# Altium schematic sheet 05.Motor_Drive.schdoc: 06.Motor_Drive
size A4; Revision: V1; SheetNumber: 7; SheetTotal: 7; Project: STC16F40K128
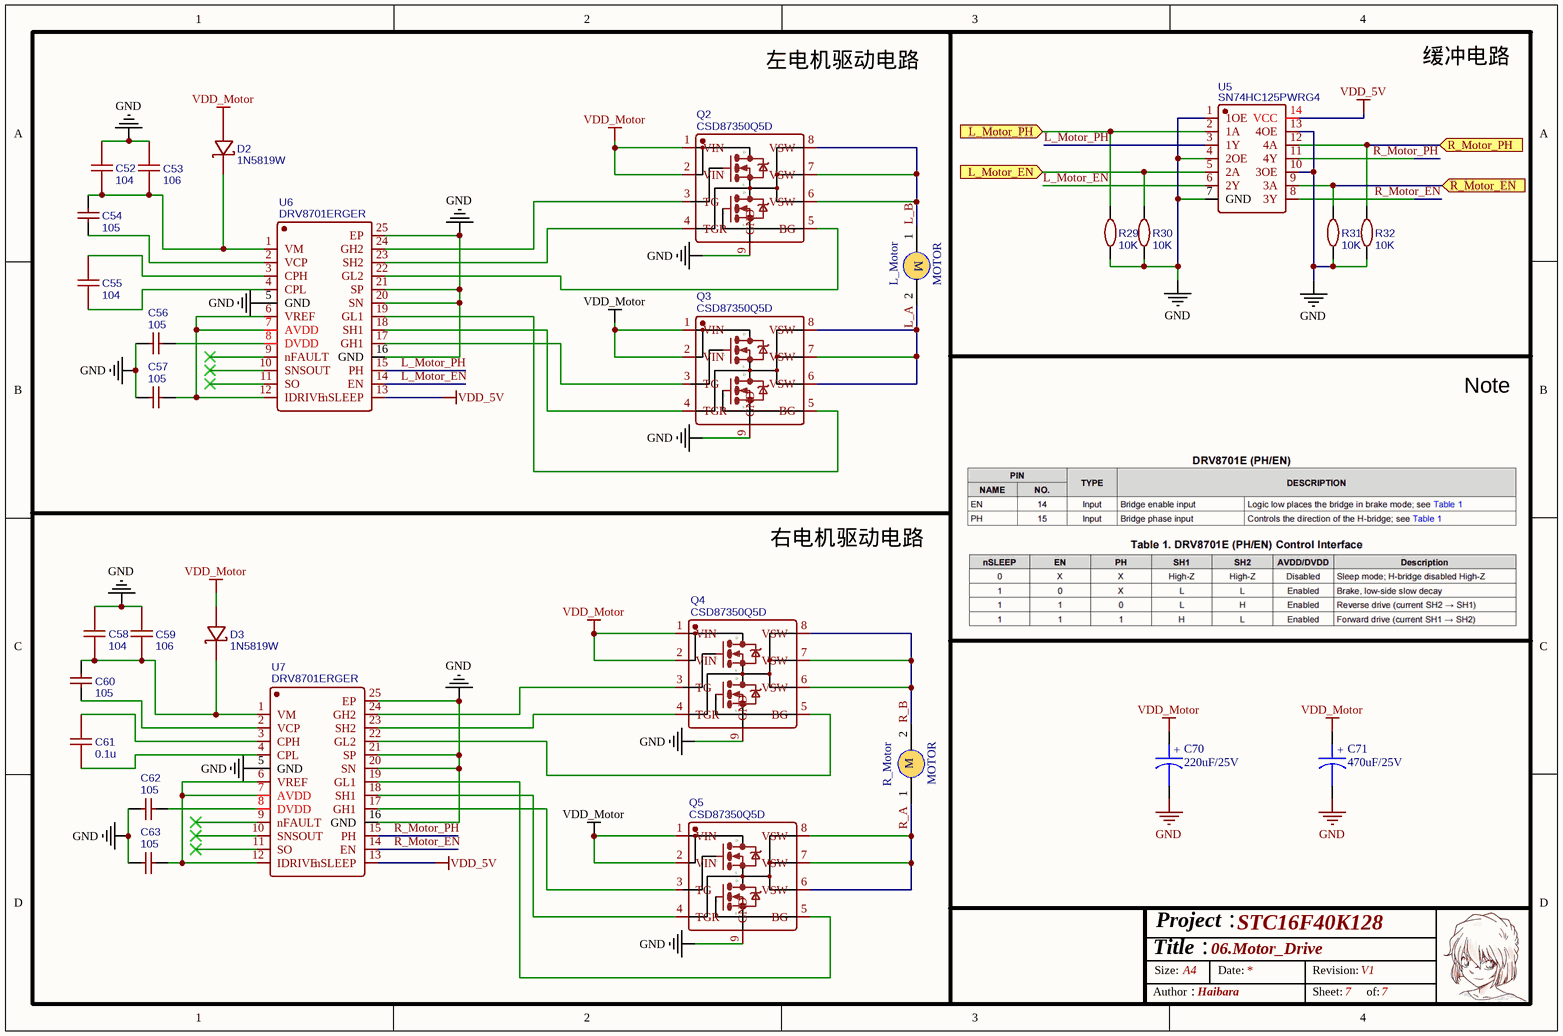
[diagram p0: 05.Motor_Drive.schdoc]

## Parts
C52  104  [C0603]
C53  106  [C0805]
C54  105  [C0603]
C55  104  [C0603]
C56  105  [C0603]
C57  105  [C0603]
C58  104  [C0603]
C59  106  [C0805]
C60  105  [C0603]
C61  0.1u  [C0603]
C62  105  [C0603]
C63  105  [C0603]
C70  220uF/25V  [CAP 2.5*6.3*11.2]
C71  470uF/25V  [CAP 3.5*8*11.5 - BK]
D2  1N5819W  [SOD-123F_L2.8-W1.8-LS3.7-RD]
D3  1N5819W  [SOD-123F_L2.8-W1.8-LS3.7-RD]
L_Motor  MOTOR  [XT30 母头 电源插头]
Q2  CSD87350Q5D  [LSON-8_L6.0-W5.0-P1.27-LS6.0-TL-EP]
Q3  CSD87350Q5D  [LSON-8_L6.0-W5.0-P1.27-LS6.0-TL-EP]
Q4  CSD87350Q5D  [LSON-8_L6.0-W5.0-P1.27-LS6.0-TL-EP]
Q5  CSD87350Q5D  [LSON-8_L6.0-W5.0-P1.27-LS6.0-TL-EP]
R29  10K  [R0603]
R30  10K  [R0603]
R31  10K  [R0603]
R32  10K  [R0603]
R_Motor  MOTOR  [XT30 母头 电源插头]
U5  SN74HC125PWRG4  [TSSOP-14_L5.0-W4.4-P0.65-LS6.4-TL]
U6  DRV8701ERGER  [VQFN-24_L4.0-W4.0-P0.50-BL-EP2.8]
U7  DRV8701ERGER  [VQFN-24_L4.0-W4.0-P0.50-BL-EP2.8]

## Ports
L_Motor_EN (in), L_Motor_PH (in), R_Motor_EN (in), R_Motor_PH (in)

## Nets
GND: C52.2 C53.1 C56.2 C57.2 C58.2 C59.1 C62.2 C63.1 C70.2 C71.2 Q2.9(GND) Q3.9(GND) Q4.9(GND) Q5.9(GND) R29.1 R30.1 R31.1 R32.1 U5.1(1OE) U5.4(2OE) U5.7(GND) U5.10(3OE) U5.13(4OE) U6.5(GND) U6.16(GND) U6.20(SN) U6.21(SP) U6.25(EP) U7.5(GND) U7.16(GND) U7.20(SN) U7.21(SP) U7.25(EP)
VDD_5V: U5.14(VCC) U6.13(nSLEEP) U7.13(nSLEEP)
VDD_Motor: C70.1 C71.1 D2.2 D3.2 Q2.1(VIN) Q2.2(VIN) Q3.1(VIN) Q3.2(VIN) Q4.1(VIN) Q4.2(VIN) Q5.1(VIN) Q5.2(VIN)
L_A: L_Motor.2 Q3.6(VSW) Q3.7(VSW) Q3.8(VSW)
L_B: L_Motor.1 Q2.6(VSW) Q2.7(VSW) Q2.8(VSW)
L_Motor_EN: R30.2 U5.5(2A) ; port L_Motor_EN
L_Motor_EN: U5.6(2Y) U6.14(EN)  [a separate net that carries the same name]
L_Motor_PH: R29.2 U5.2(1A) ; port L_Motor_PH
L_Motor_PH: U5.3(1Y) U6.15(PH)  [a separate net that carries the same name]
R_A: Q5.6(VSW) Q5.7(VSW) Q5.8(VSW) R_Motor.1
R_B: Q4.6(VSW) Q4.7(VSW) Q4.8(VSW) R_Motor.2
R_Motor_EN: U5.8(3Y) U7.14(EN)
R_Motor_EN: R31.2 U5.9(3A) ; port R_Motor_EN  [a separate net that carries the same name]
R_Motor_PH: U5.11(4Y) U7.15(PH)
R_Motor_PH: R32.2 U5.12(4A) ; port R_Motor_PH  [a separate net that carries the same name]
NetC52_1: C52.1 C53.2 C54.2 D2.1 U6.1(VM)
NetC54_1: C54.1 U6.2(VCP)
NetC55_1: C55.1 U6.4(CPL)
NetC55_2: C55.2 U6.3(CPH)
NetC56_1: C56.1 U6.8(DVDD)
NetC57_1: C57.1 U6.6(VREF) U6.7(AVDD) U6.12(IDRIVE)
NetC58_1: C58.1 C59.2 C60.2 D3.1 U7.1(VM)
NetC60_1: C60.1 U7.2(VCP)
NetC61_1: C61.1 U7.4(CPL)
NetC61_2: C61.2 U7.3(CPH)
NetC62_1: C62.1 U7.8(DVDD)
NetC63_2: C63.2 U7.6(VREF) U7.7(AVDD) U7.12(IDRIVE)
NetQ2_3: Q2.3(TG) U6.24(GH2)
NetQ2_4: Q2.4(TGR) U6.23(SH2)
NetQ2_5: Q2.5(BG) U6.22(GL2)
NetQ3_3: Q3.3(TG) U6.17(GH1)
NetQ3_4: Q3.4(TGR) U6.18(SH1)
NetQ3_5: Q3.5(BG) U6.19(GL1)
NetQ4_3: Q4.3(TG) U7.24(GH2)
NetQ4_4: Q4.4(TGR) U7.23(SH2)
NetQ4_5: Q4.5(BG) U7.22(GL2)
NetQ5_3: Q5.3(TG) U7.17(GH1)
NetQ5_4: Q5.4(TGR) U7.18(SH1)
NetQ5_5: Q5.5(BG) U7.19(GL1)

Not connected (* = marked no-connect by the designer): U6 9(nFAULT)* 10(SNSOUT)* 11(SO)*; U7 9(nFAULT)* 10(SNSOUT)* 11(SO)*

## Notes on the sheet
- 左电机驱动电路
- 缓冲电路
- Note
- 右电机驱动电路
- Title：
- Size:
- Project：
- A4
- Date:
- Revision:
- Author：
- Haibara
- Sheet:
- of:
- (in symbol CAP POL) +
- (in symbol CSD87350Q5D) D; G; S
- (in symbol MOTOR1) M

## Library data of the parts
C52 C55 C58 C61 = 0.1u: nameAlias: Value(F); Contributor: LCEDA_Lib; spicePre: C; spiceSymbolName: C_0603_US
C53 C59 = 10uF: BOM_Manufacturer: Huaxin S&T; BOM_Manufacturer Part: 0805F106Z160CT; nameAlias: Capacitance; Contributor: LCSC; BOM_Supplier: LCSC; BOM_Supplier Part: C303921; BOM_JLCPCB Part Class: Extended Part; spicePre: C; spiceSymbolName: 0805F106Z160CT
C54 C56 C57 C60 C62 C63 = 1uF: BOM_Manufacturer Part: CL10B105KO8NNNC; BOM_Manufacturer: SAMSUNG; nameAlias: Capacitance; BOM_Supplier: LCSC; BOM_Supplier Part: C59782; BOM_JLCPCB Part Class: Extended Part; spicePre: C; spiceSymbolName: CL10B105KO8NNNC
C70 C71 = CAP POL: Capacitor
D2 D3 = 1N5819W: BOM_Manufacturer: Shandong Jingdao Microelectronics; Contributor: LCSC; BOM_Supplier: LCSC; BOM_Supplier Part: C169540; BOM_Manufacturer Part: 1N5819W; BOM_JLCPCB Part Class: Extended Part; spicePre: D; spiceSymbolName: 1N5819W
L_Motor R_Motor = MOTOR1
Q2-Q5 = CSD87350Q5D: BOM_Manufacturer: Texas Instruments; Contributor: LCSC; BOM_Supplier: LCSC; BOM_Supplier Part: C140356; BOM_Manufacturer Part: CSD87350Q5D; BOM_JLCPCB Part Class: Extended Part; spicePre: Q; spiceSymbolName: CSD87350Q5D
R29-R32 = 10K: BOM_Manufacturer: YAGEO; BOM_Manufacturer Part: RT0603BRD0710KL; nameAlias: Resistance (Ohms); Resistance: 10kΩ; BOM_Supplier: LCSC; BOM_Supplier Part: C95204; BOM_JLCPCB Part Class: Extended Part; spicePre: R; spiceSymbolName: RT0603BRD0710KL
U5 = SN74HC125PWRG4: BOM_Manufacturer: TI(德州仪器); Contributor: LCSC; BOM_Supplier: LCSC; BOM_Supplier Part: C2676184; BOM_Manufacturer Part: SN74HC125PWRG4; BOM_JLCPCB Part Class: Extended Part; spicePre: U; spiceSymbolName: SN74HC125PWRG4
U6 U7 = DRV8701ERGER: BOM_Manufacturer: Texas Instruments; Contributor: LCSC; BOM_Supplier: LCSC; BOM_Supplier Part: C90964; BOM_Manufacturer Part: DRV8701ERGER; BOM_JLCPCB Part Class: Extended Part; spicePre: U; spiceSymbolName: DRV8701ERGER